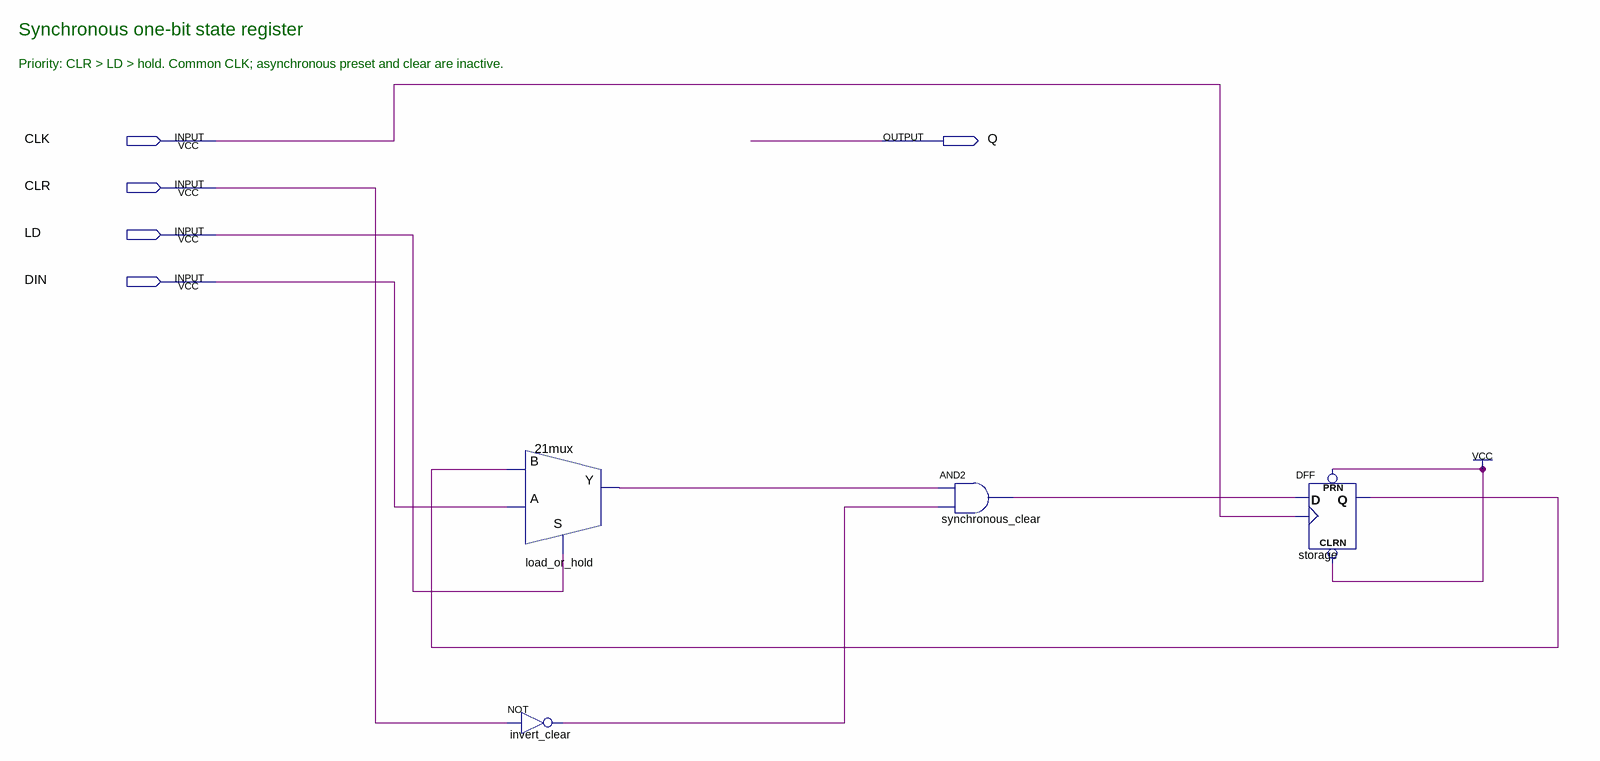
[diagram p0: schematic sheet]
// Quartus schematic state_bit.bdf as structural Verilog: 4 symbols, 5 pins
module state_bit (
  input  CLK,
  input  CLR,
  input  LD,
  input  DIN,
  output Q
);

  wire NEXT_Q, NOT_CLR, SELECTED;

  \21mux  load_or_hold (.B(Q), .A(DIN), .S(LD), .Y(SELECTED));
  not invert_clear (NOT_CLR, CLR);
  and synchronous_clear (NEXT_Q, SELECTED, NOT_CLR);
  DFF storage (.CLRN(1'b1), .CLK(CLK), .D(NEXT_Q), .PRN(1'b1), .Q(Q));

  // Notes on the sheet:
  //   Synchronous one-bit state register
  //   Priority: CLR > LD > hold. Common CLK; asynchronous preset and clear are inactive.
endmodule
